# Altium project 无线充电.PrjPcb
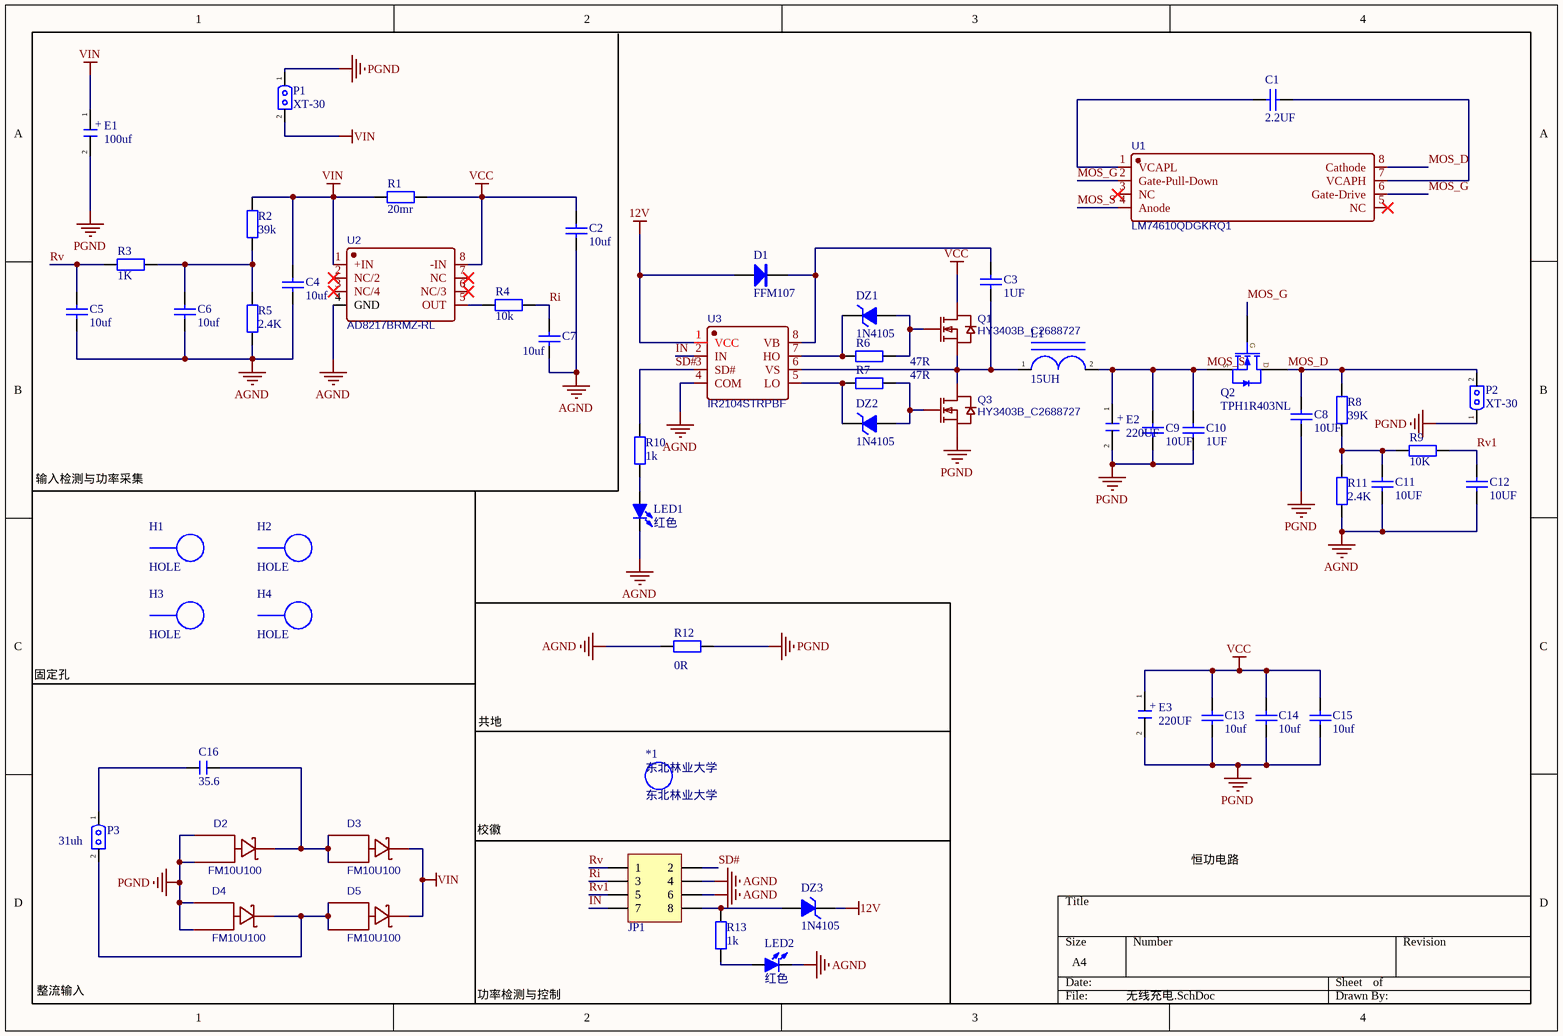
[diagram p0: 无线充电.SchDoc]
1 sheet, 58 parts. Net scope: global (net labels, ports and power ports of the same name join across sheets).
Board file: 无线充电.PcbDoc

## Sheet 无线充电.SchDoc
size A4; SheetNumber: 1; SheetTotal: 1

### Parts
*1  东北林业大学  [校徽300mil]
C1  2.2UF  [0805_C]
C2  10uf  [0805_C]
C3  1UF  [0805_C]
C4  10uf  [0805_C]
C5  10uf  [0805_C]
C6  10uf  [0805_C]
C7  10uf  [0805_C]
C8  10UF  [0805_C]
C9  10UF  [0805_C]
C10  1UF  [0805_C]
C11  10UF  [0805_C]
C12  10UF  [0805_C]
C13  10uf  [0805_C]
C14  10uf  [0805_C]
C15  10uf  [0805_C]
C16  35.6  [C 1210_L]
D1  FFM107  [SOD-123]
D2  FM10U100  [TO-277B_3P-L6.1-W4.3-LS7.0-TR]
D3  FM10U100  [TO-277B_3P-L6.1-W4.3-LS7.0-TR]
D4  FM10U100  [TO-277B_3P-L6.1-W4.3-LS7.0-TR]
D5  FM10U100  [TO-277B_3P-L6.1-W4.3-LS7.0-TR]
DZ1  1N4105  [SOD-123]
DZ2  1N4105  [SOD-123]
DZ3  1N4105  [SOD-123]
E1  100uf  [CM F(10*10.2)]
E2  220UF  [CM F(10*10.2)]
E3  220UF  [CM F(10*10.2)]
H1  HOLE  [LQ_SCROW3&5MM]
H2  HOLE  [LQ_SCROW3&5MM]
H3  HOLE  [LQ_SCROW3&5MM]
H4  HOLE  [LQ_SCROW3&5MM]
JP1  Header 4X2  [CONN-TH_A2006WV-2X4P]  (value not drawn)
L1  15UH  [IND-SMD_L17.5-W17.2]
LED1  红色  [LED 0805B]
LED2  红色  [LED 0805B]
P1  XT-30  [xt-30 - duplicate]
P2  XT-30  [xt-30 - duplicate]
P3  31uh  [线圈]
Q1  HY3403B_C2688727  [TO-263-2_L10.1-W9.1-P5.08-LS15.2-BR]
Q2  TPH1R403NL  [SOP Advance]
Q3  HY3403B_C2688727  [TO-263-2_L10.1-W9.1-P5.08-LS15.2-BR]
R1  20mr  [1206_R]
R2  39k  [0805_R]
R3  1K  [0805_R]
R4  10k  [0805_R]
R5  2.4K  [0805_R]
R6  47R  [0805_R]
R7  47R  [0805_R]
R8  39K  [0805_R]
R9  10K  [0805_R]
R10  1k  [0805_R]
R11  2.4K  [0805_R]
R12  0R  [0805_R]
R13  1k  [0805_R]
U1  LM74610QDGKRQ1  [VSSOP-8_L3.0-W3.0-P0.65-LS5.0-BL]
U2  AD8217BRMZ-RL  [MSOP-8_L3.0-W3.0-P0.65-LS4.9-BL]
U3  IR2104STRPBF  [SOIC-8_L4.9-W3.9-P1.27-LS6.0-BL]

### Nets
12V: D1.1(A) DZ3.2(K) U3.1(VCC)
AGND: C2.1 C4.1 C5.1 C6.1 C7.1 C11.1 C12.1 JP1.4 JP1.6 LED1.2(K) LED2.2(K) R5.1 R11.2 R12.2 U2.4(GND) U3.4(COM)
PGND: C8.1 C9.1 C10.1 C13.1 C14.1 C15.1 D2.1(A) D2.3(A) D4.1(A) D4.3(A) E1.2 E2.2 E3.2 P1.1 P2.1 Q3.3(S) R12.1
VCC: C2.2 C13.2 C14.2 C15.2 E3.1 Q1.2(D) R1.2 U2.8(-IN)
VIN: C4.2 D3.2(C) D5.2(C) E1.1 P1.2 R1.1 R2.2 U2.1(+IN)
IN: JP1.7 U3.2(IN)
MOS_D: C8.2 P2.2 Q2.2(D) R8.1 U1.8(Cathode)
MOS_G: Q2.3(G) U1.2(Gate-Pull-Down) U1.6(Gate-Drive)
MOS_S: C9.2 C10.2 E2.1 L1.2 Q2.1(S) U1.4(Anode)
Ri: C7.2 JP1.3 R4.2
Rv: C5.2 JP1.1 R3.2
Rv1: C12.2 JP1.5 R9.2
SD#: JP1.2 R10.2 U3.3(SD#)
NetC1_1: C1.1 U1.7(VCAPH)
NetC1_2: C1.2 U1.1(VCAPL)
NetC3_1: C3.1 D1.2(K) U3.8(VB)
NetC3_2: C3.2 L1.1 Q1.3(S) Q3.2(D) U3.6(VS)
NetC6_2: C6.2 R2.1 R3.1 R5.2
NetC11_2: C11.2 R8.2 R9.1 R11.1
NetC16_1: C16.1 P3.1
NetC16_2: C16.2 D2.2(C) D3.1(A) D3.3(A)
NetD4_2: D4.2(C) D5.1(A) D5.3(A) P3.2
NetDZ1_1: DZ1.1(A) Q1.1(G) R6.1
NetDZ1_2: DZ1.2(K) R6.2 U3.7(HO)
NetDZ2_1: DZ2.1(A) Q3.1(G) R7.1
NetDZ2_2: DZ2.2(K) R7.2 U3.5(LO)
NetDZ3_1: DZ3.1(A) JP1.8 R13.2
NetLED1_1: LED1.1(A) R10.1
NetLED2_1: LED2.1(A) R13.1
NetR4_1: R4.1 U2.5(OUT)

Not connected (* = marked no-connect by the designer): U1 3(NC)* 5(NC)*; U2 2(NC/2)* 3(NC/4)* 6(NC/3)* 7(NC)*

### Notes on the sheet
- 输入检测与功率采集
- 固定孔
- 共地
- 校徽
- 恒功电路
- 整流输入
- 功率检测与控制
- (in symbol C-CM) +

### Library data of the parts
C1-C15 = 0805 10nF (103) 10% 50V: 贴片电容; ComponentLink1Description: 供应商链接; ComponentLink1URL: http://www.szlcsc.com/product/details_2062.html; Package: 0805; Supplier: LC; SuppliersPartNumber: C1710
C16 = C: 无极性贴片电容; 版权归属: 源创客; 材质: X7R; BOM名称: 无极性贴片电容; 学习资源: www.ooocke.com
D1 = FR107w: 快恢复整流二极管; BOM名称: 快恢复二极管; 版权归属: 源创客; 学习资源: www.ooocke.com
D2-D5 = FM10U100: BOM_Manufacturer: Formosa Microsemi; Contributor: LCSC; BOM_Supplier: LCSC; BOM_Supplier Part: C376165; BOM_Manufacturer Part: FM10U100; BOM_JLCPCB Part Class: Extended Part; spicePre: D; spiceSymbolName: FM10U100
DZ1-DZ3 = 1N4105: 11V/0.5W稳压管; 版权归属: 源创客; BOM名称: 11V/0.5W稳压管; 学习资源: www.ooocke.com
E1-E3 = C-CM: 贴片电解电容; 版权归属: 源创客; BOM名称: 贴片电解电容; 学习资源: www.ooocke.com
H1-H4 = HOLE: 固定孔
JP1 = Header 4X2: 4*2P接插件; 版权归属: 源创客; BOM名称: 4*2P接插件; 学习资源: www.ooocke.com
L1 = L: 一体化成型电感
LED1 LED2 = LED-5MM: 0805LED; BOM名称: 5mm插件LED; 版权归属: 源创客; 学习资源: www.ooocke.com
P1 P2 = XT-30_1: 接口
P3 = 线圈: 接口
Q1 Q3 = HY3403B_C2688727: BOM_Manufacturer: HUAYI(华羿微); Contributor: LCSC; BOM_Supplier: LCSC; BOM_Supplier Part: C2688727; BOM_Manufacturer Part: HY3403B; BOM_JLCPCB Part Class: Extended Part; spicePre: Q; spiceSymbolName: HY3403B_C2688727
R1 = 1206 0.1Ω (R100) 1%: 贴片电阻; ComponentLink1Description: 供应商链接; ComponentLink1URL: http://www.szlcsc.com/product/details_26077.html; Package: 1206; Supplier: LC; SuppliersPartNumber: C25334
R2-R13 = 0805 10MΩ (1005) 1%: 贴片电阻; ComponentLink1Description: 供应商链接; ComponentLink1URL: http://www.szlcsc.com/product/details_26851.html; Package: 0805; Supplier: LC; SuppliersPartNumber: C26108
U1 = LM74610QDGKRQ1: BOM_Manufacturer: TI(德州仪器); Contributor: lcsc; BOM_Supplier: LCSC; BOM_Supplier Part: C2649431; BOM_Manufacturer Part: LM74610QDGKRQ1; link: https://atta.szlcsc.comnull; spicePre: U; spiceSymbolName: LM74610QDGKRQ1
U2 = AD8217BRMZ-RL: BOM_Manufacturer: Analog Devices; Contributor: LCSC; BOM_Supplier: LCSC; BOM_Supplier Part: C652512; BOM_Manufacturer Part: AD8217BRMZ-RL; BOM_JLCPCB Part Class: Extended Part; spicePre: U; spiceSymbolName: AD8217BRMZ-RL
U3 = IR2104STRPBF: BOM_Manufacturer: IR; spicePre: X; BOM_Supplier: LCSC; BOM_Manufacturer Part: IR2104STRPBF; BOM_Supplier Part: C2960; BOM_JLCPCB Part Class: Extended Part; spiceSymbolName: IR2104STRPBF
Q2 = TPH1R403NL: Package: SOT-23-6; Supplier: LC; SuppliersPartNumber: C32254